# Altium schematic sheet JTAG_Rig_Programmer_Interface.SchDoc
size A; Author: Jared Ainsworth; CompanyName: UpRev LLC; Engineer: Jared Ainsworth; Organization: UpRev LLC; Address1: 4807 Commercial Park Dr.; Address2: Austin, TX 78724; Address3: United States; Address4: www.UpRev.com; SheetNumber: 7; SheetTotal: 13
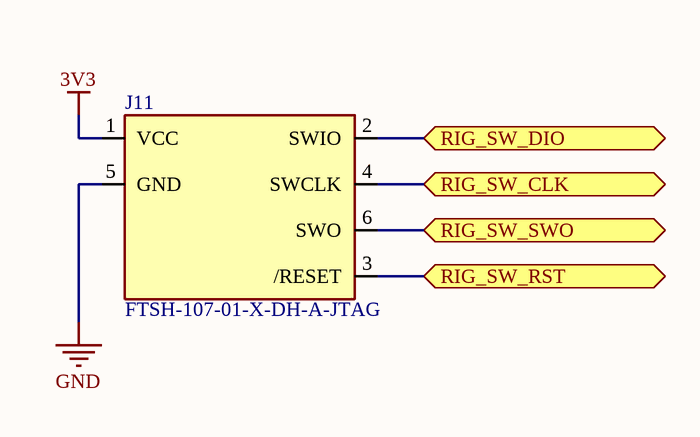
[diagram p0: JTAG_Rig_Programmer_Interface.SchDoc]

## Parts
J11  FTSH-107-01-X-DH-A-JTAG  [Connector 14 pos SAMTEC_FTSH-107-01-X-DH-A]

## Ports
RIG_SW_CLK (bidir, see Top_Level[2A], Dev_Board_Connection[1D]), RIG_SW_DIO (bidir, see Top_Level[2B], Dev_Board_Connection[1D]), RIG_SW_RST (bidir, see Top_Level[2B], Dev_Board_Connection[1D]), RIG_SW_SWO (bidir, see Top_Level[2B], Dev_Board_Connection[1D])

## Nets
3V3: J11.1(VCC)
GND: J11.5(GND)
RIG_SW_CLK: J11.4(SWCLK) ; port RIG_SW_CLK
RIG_SW_DIO: J11.2(SWIO) ; port RIG_SW_DIO
RIG_SW_RST: J11.3(/RESET) ; port RIG_SW_RST
RIG_SW_SWO: J11.6(SWO) ; port RIG_SW_SWO

## Notes on the sheet
- Title
- Size:
- Engineer:
- A
- Number:
- Revision:
- Sheet
- of
- File:

## Library data of the parts
J11 = FTSH-107-01-X-DH-A-JTAG: 14 pos High Reliability Header Strips, 0.050in pitch, Right Angle, Alignment Pins; Manufacturer: Samtec; Package: SMD,P=1.27mm,Surface Mount，Right Angle; Manufacturer Part Number: FTSH-107-01-X-DH-A; LCSC Part Number: C21934755